# Altium schematic sheet DishConnector.SchDoc
size A; SheetNumber: 2; SheetTotal: 2
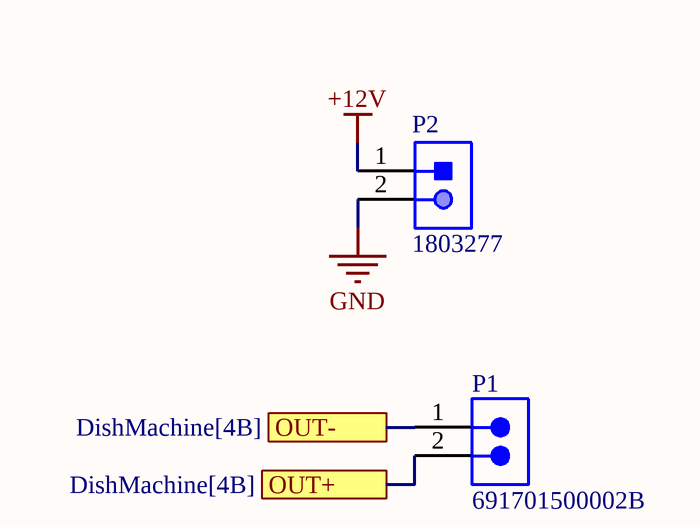
[diagram p0: DishConnector.SchDoc]

## Parts
P1  691701500002B  [691701500002B]
P2  1803277  [PHOE-1803277_V]

## Ports
OUT+ (see DishMachine[4B]), OUT- (see DishMachine[4B])

## Nets
+12V: P2.1
GND: P2.2
OUT+: P1.2 ; port OUT+
OUT-: P1.1 ; port OUT-

## Library data of the parts
P1 = CMP-1502-02318-3: Terminal Block, 5.08MM, Open Vertical Pcb Header, Thr Type, 2 Pins; Gender: Male; Number of Contacts: 2; Current Rating: 10A; Voltage Rating: 300V; Mount: Through Hole; Max Operating Temperature: 105°C; Contact Gender: Male; REACH SVHC: Unknown; Color: Black; Number of Pins: 2; RoHS: Compliant; Contact Material: Brass; Length: 9.76mm; Min Operating Temperature: -40°C; Housing Material: Polymer; Pitch: 5.08mm; Connector Type: Terminal Block; Contact Plating: Tin; Lead Pitch: 5.08mm; Termination: PCB
P2 = CMP-002-00014-2: Male Header, Pitch 3.81 mm, 1 x 2 Position, Height 7.25 mm, Tail Length 3.4 mm, RoHS, Bulk; Manufacturer: Phoenix Contact; Voltage Rating: 160V; Current Rating: 8A; Rows: 1; Mounting Technology: TH; Contact Plating: Tin; Case/Package: 1803277; Gender: Male; Diameter: 7.25mm; Datasheet Version: Feb-14; Colour: Green; Pins: 2; Lead Pitch: 0.15inch; Connector Type: Header; Package Quantity: 50; Max Current Rating: 8A; Manufacturer URL: http://www.phoenixcontact.com/; Packaging: Bulk; RoHS Compliant: True; Datasheet URL: https://datasheet.ciiva.com/16096/1803277-16096845.pdf; Package Reference: 1803277; Package Description: Male Header, Pitch 3.81 mm, 1 x 2 Position, Height 7.25 mm, Tail Length 3.4 mm